# Altium schematic sheet USB_Host.SchDoc
size A4; DocumentNumber: 25; SheetNumber: 25; SheetTotal: 28
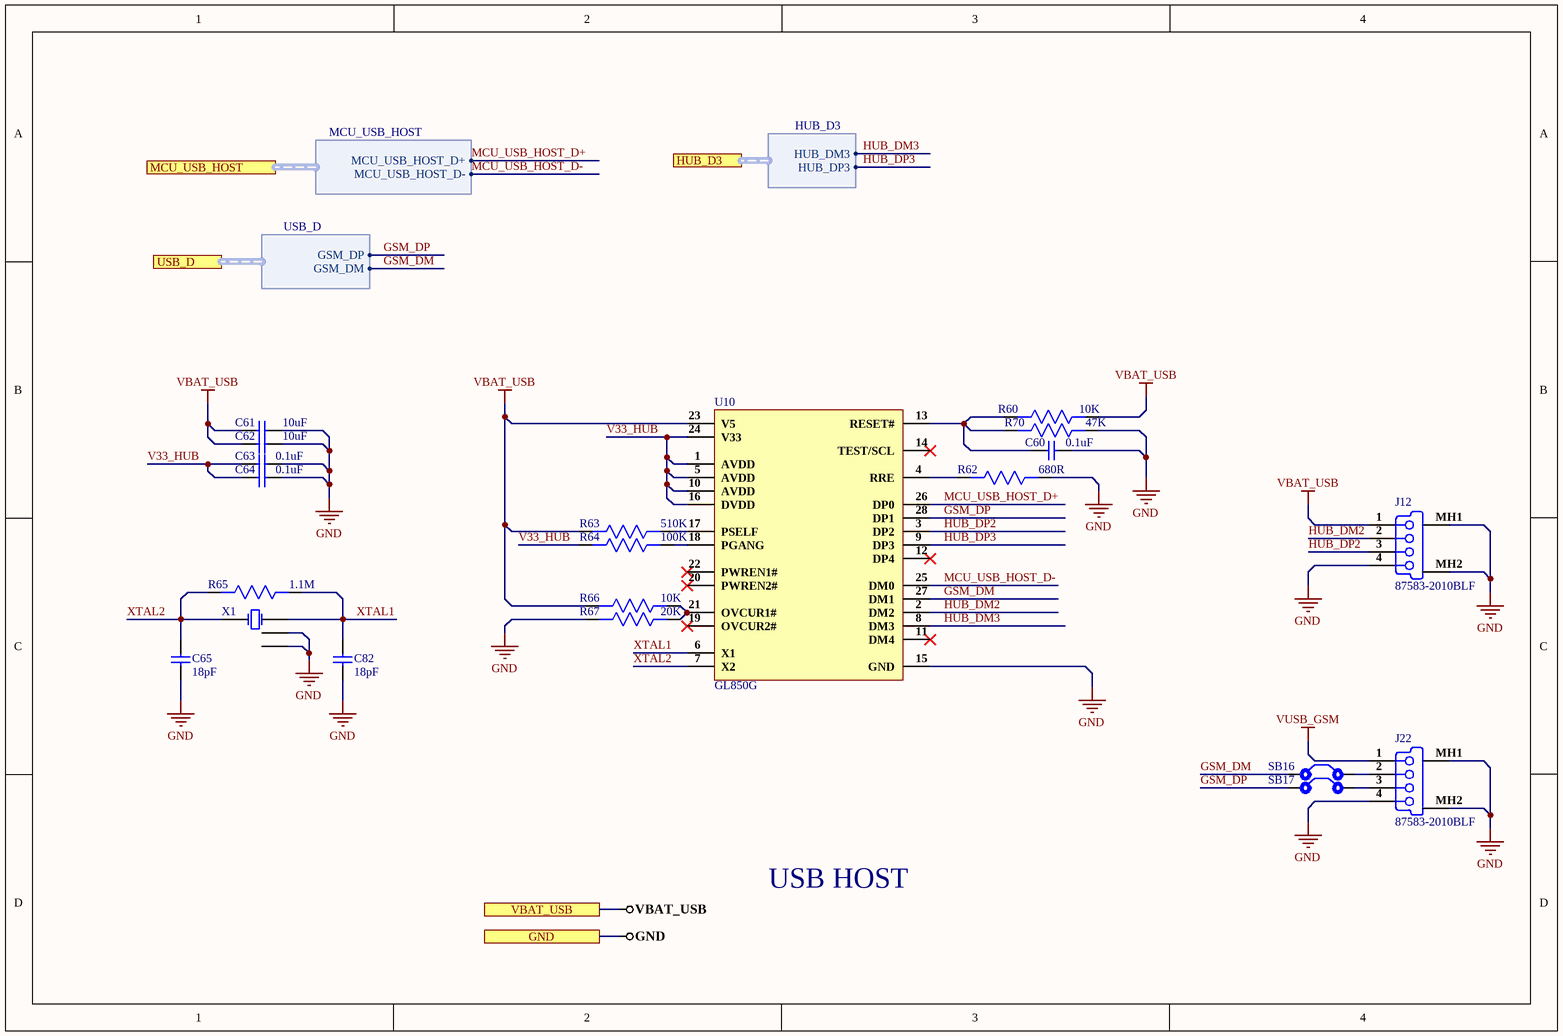
[diagram p0: USB_Host.SchDoc]

## Parts
C60  0.1uF  [Cap0603]
C61  10uF  [Cap0603]
C62  10uF  [Cap0603]
C63  0.1uF  [Cap0603]
C64  0.1uF  [Cap0603]
C65  18pF  [Cap0603]
C82  18pF  [Cap0603]
J12  87583-2010BLF  [87583-2010BLF]
J22  87583-2010BLF  [87583-2010BLF]
R60  10K  [Res0603]
R62  680R  [Res0603]
R63  510K  [Res0603]
R64  100K  [Res0603]
R65  1.1M  [Res0603]
R66  10K  [Res0603]
R67  20K  [Res0603]
R70  47K  [Res-0201]
SB16  Solder Bridge  [Solder Bridge]  (value not drawn)
SB17  Solder Bridge  [Solder Bridge]  (value not drawn)
U10  GL850G  [SSOP-28]
X1  8Z-12.000MAAJ-T  [8Z-12.000MAAJ-T]  (value not drawn)

## Ports
GND, HUB_D3 (harness HUB_D3), MCU_USB_HOST (harness MCU_USB_HOST), USB_D (harness USB_D), VBAT_USB

## Harnesses
MCU_USB_HOST: MCU_USB_HOST_D+, MCU_USB_HOST_D-
HUB_D3: HUB_DM3, HUB_DP3
USB_D: GSM_DP, GSM_DM

## Nets
GND: C60.2 C61.2 C62.2 C63.2 C64.2 C65.1 C82.1 J12.4(GND) J12.MH1(Tab) J12.MH2(Tab) J22.4(GND) J22.MH1(Tab) J22.MH2(Tab) R62.1 R67.2 R70.1 U10.15(GND) X1.2(GND) X1.4(GND) ; port GND
VBAT_USB: C61.1 C62.1 J12.1(V_BUS_(5V)) R60.1 R63.2 R66.2 U10.23(V5) ; port VBAT_USB
VUSB_GSM: J22.1(V_BUS_(5V))
GSM_DM: SB16.1 U10.27(DM1) ; port USB_D.GSM_DM
GSM_DP: SB17.1 U10.28(DP1) ; port USB_D.GSM_DP
HUB_DM2: J12.2(D-) U10.2(DM2)
HUB_DM3: U10.8(DM3) ; port HUB_D3.HUB_DM3
HUB_DP2: J12.3(D+) U10.3(DP2)
HUB_DP3: U10.9(DP3) ; port HUB_D3.HUB_DP3
MCU_USB_HOST_D+: U10.26(DP0) ; port MCU_USB_HOST.MCU_USB_HOST_D+
MCU_USB_HOST_D-: U10.25(DM0) ; port MCU_USB_HOST.MCU_USB_HOST_D-
V33_HUB: C63.1 C64.1 R64.2 U10.1(AVDD) U10.5(AVDD) U10.10(AVDD) U10.16(DVDD) U10.24(V33)
XTAL1: C82.2 R65.1 U10.6(X1) X1.1(OSC1)
XTAL2: C65.2 R65.2 U10.7(X2) X1.3(OSC2)
NetC60_1: C60.1 R60.2 R70.2 U10.13(RESET#)
NetJ22_2: J22.2(D-) SB16.2
NetJ22_3: J22.3(D+) SB17.2
NetR62_2: R62.2 U10.4(RRE)
NetR63_1: R63.1 U10.17(PSELF)
NetR64_1: R64.1 U10.18(PGANG)
NetR66_1: R66.1 R67.1 U10.21(OVCUR1#)

Not connected (* = marked no-connect by the designer): U10 11(DM4)* 12(DP4)* 14(TEST/SCL)* 19(OVCUR2#)* 20(PWREN2#)* 22(PWREN1#)*

## Notes on the sheet
- USB HOST

## Library data of the parts
C60 C63 C64 = CC0603ZRY5V9BB104: CAP CER 0.1UF 50V Y5V 0603; Manufacturer: Yageo; Capacitance: 100nF; Tolerance: 80%; Supplier 1: Digi-Key; Manufacturer Part Number: CC0603ZRY5V9BB104; Stock 1: 15000880; Pricing 1: 1=0.1, 10=0.075, 100=0.0334, 500=0.02386, 1000=0.01874 (USD); Mount: Surface Mount; Case/Package: 0603; Number of Pins: 2; Case Code (Metric): 1608; Case Code (Imperial): 0603; Min Operating Temperature: -30°C; Max Operating Temperature: 85°C; Dielectric: Y5V; Voltage Rating: 50V; Package Quantity: 1; Packaging: Tape and Reel; Voltage Rating (DC): 50V; Termination: SMD/SMT; Composition: Ceramic; Voltage: 50V; Length: 1.6mm; Height: 0.8mm; Width: 0.031inch; Thickness: 0.035inch; Depth: 0.8mm; Radiation Hardening: No; REACH SVHC: No SVHC; Lead Free: Lead Free; Halogen Free: Halogen Free; ComponentLink1URL: http://www.yageo.com/documents/recent/UPY-GPHC_Y5V_6.3V-to-50V_8.pdf?src-supplier=Digi-Key; ComponentLink1Description: http://www.yageo.com/documents/recent/UPY-GPHC_Y5V_6.3V-to-50V_8.pdf?src-supplier=Digi-Key; ComponentLink2URL: http://www.yageo.com/documents/recent/UPY-GPHC_Y5V_6.3V-to-50V_5.pdf?src-supplier=Avnet+Europe; ComponentLink2Description: http://www.yageo.com/documents/recent/UPY-GPHC_Y5V_6.3V-to-50V_5.pdf?src-supplier=Avnet+Europe; ComponentLink3URL: https://www.verical.com/server-webapp/html/getDatasheet?partID=403611&src-supplier=Verical; ComponentLink3Description: https://www.verical.com/server-webapp/html/getDatasheet?partID=403611&src-supplier=Verical; ComponentLink4URL: http://www.mouser.com/ds/2/447/Yageo_UPY-GP_NP0_16V-to-50V_9-358835.pdf?src-supplier=Mouser; ComponentLink4Description: http://www.mouser.com/ds/2/447/Yageo_UPY-GP_NP0_16V-to-50V_9-358835.pdf?src-supplier=Mouser; ComponentLink5URL: http://www.farnell.com/datasheets/1132289.pdf?src-supplier=Element14; ComponentLink5Description: http://www.farnell.com/datasheets/1132289.pdf?src-supplier=Element14; Supplier Part Number 1: 311-1343-1-ND
C61 C62 = GRM188R6YA106MA73D: CAP CER 10UF 35V X5R 0603; Manufacturer: Murata; Tolerance: 20%; Supplier 1: Digi-Key; Manufacturer Part Number: GRM188R6YA106MA73D; Stock 1: 11640; Pricing 1: 1=0.5, 10=0.346, 100=0.2076, 500=0.1557, 1000=0.13148 (USD); Mount: Surface Mount; Case/Package: 0603; Case Code (Metric): 1608; Case Code (Imperial): 0603; Min Operating Temperature: -55°C; Max Operating Temperature: 85°C; Packaging: Tape and Reel; Capacitance: 10uF; Voltage Rating: 35V; Voltage Rating (DC): 35V; Dielectric: X5R; Length: 0.063inch; Width: 0.031inch; Thickness: 0.039inch; ComponentLink1URL: http://search.murata.co.jp/Ceramy/image/img/A01X/G101/ENG/GRM188R6YA106MA73-01.pdf?src-supplier=Digi-Key; ComponentLink1Description: http://search.murata.co.jp/Ceramy/image/img/A01X/G101/ENG/GRM188R6YA106MA73-01.pdf?src-supplier=Digi-Key; ComponentLink2URL: http://search.murata.co.jp/Ceramy/image/img/A01X/G101/ENG/GRM188R6YA106MA73-01.pdf?src-supplier=Mouser; ComponentLink2Description: http://search.murata.co.jp/Ceramy/image/img/A01X/G101/ENG/GRM188R6YA106MA73-01.pdf?src-supplier=Mouser; ComponentLink3URL: https://www.murata.com/~/media/webrenewal/support/library/catalog/products/capacitor/mlcc/c02e.ashx?la=en-us&src-supplier=Digi-Key; ComponentLink3Description: https://www.murata.com/~/media/webrenewal/support/library/catalog/products/capacitor/mlcc/c02e.ashx?la=en-us&src-supplier=Digi-Key; ComponentLink4URL: http://search.murata.co.jp/Ceramy/image/img/A01X/G101/ENG/GRM188R6YA106MA73-01.pdf?src-supplier=Future+Electronics; ComponentLink4Description: http://search.murata.co.jp/Ceramy/image/img/A01X/G101/ENG/GRM188R6YA106MA73-01.pdf?src-supplier=Future+Electronics; ComponentLink5URL: http://search.murata.co.jp/Ceramy/image/img/A01X/G101/ENG/GRM188R6YA106MA73-01.pdf?src-supplier=TTI; ComponentLink5Description: http://search.murata.co.jp/Ceramy/image/img/A01X/G101/ENG/GRM188R6YA106MA73-01.pdf?src-supplier=TTI; Supplier Part Number 1: 490-13248-6-ND
C65 C82 = C0603C180J5GACTU: CAP CER 18PF 50V C0G/NP0 0603; Manufacturer: KEMET; Dielectric Material: Ceramic; Tolerance: 5%; Dielectric: C0G; Dissipation Factor: 0.1%; Temperature Coefficient: 30ppm/°C; Supplier 1: Digi-Key; Manufacturer Part Number: C0603C180J5GACTU; Stock 1: 196781; Pricing 1: 1=0.1, 10=0.049, 100=0.0217, 500=0.01552, 1000=0.01219 (USD); Mount: Surface Mount; Case/Package: 0603; Case Code (Imperial): 0603; Case Code (Metric): 1608; Min Operating Temperature: -55°C; Max Operating Temperature: 125°C; Packaging: Tape and Reel; Capacitance: 18pF; Package Quantity: 4000; Voltage Rating: 50V; Voltage Rating (DC): 50V; Termination: SMD/SMT; Voltage: 50V; Length: 1.6mm; Height: 0.8mm; Width: 0.8mm; Depth: 0.8mm; Radiation Hardening: No; Lead Free: Lead Free; ComponentLink1URL: http://www.kemet.com/kemet/web/homepage/kechome.nsf/file/F9080B_0402_Series_C0G/$file/F9080B_0402_Series_C0G.pdf?src-supplier=Element14; ComponentLink1Description: http://www.kemet.com/kemet/web/homepage/kechome.nsf/file/F9080B_0402_Series_C0G/$file/F9080B_0402_Series_C0G.pdf?src-supplier=Element14; ComponentLink2URL: http://www.farnell.com/datasheets/1372242.pdf?src-supplier=Element14; ComponentLink2Description: http://www.farnell.com/datasheets/1372242.pdf?src-supplier=Element14; Supplier Part Number 1: 399-1052-1-ND
J12 J22 = 87583-2010BLF: USB Connectors 4P RECEPTACLE TYPE A; Manufacturer: Amphenol FCI; Plating: Nickel; Number of Terminals/Pins: 4; Current Rating: 1A; Mating Cycles: 1500; Connector Type: USB,Receptacle; Number of Ports: 1; Contact Resistance: 30mR; Insulation Resistance: 1GR; USB Standard: USB 2.0; Supplier 1: Allied Electronics; Manufacturer Part Number: 87583-2010BLF; RoHS: Yes; Category: Connectors; Mount: Surface Mount,Horizontal; Contact Plating: GXT,Gold; Color: White; Contact Material: Copper Alloy; Body Plating: Nickel; Material: Tin; Housing Material: Thermoplastic; Min Operating Temperature: 0°C; Max Operating Temperature: 40°C; Termination: Solder; Gender: Receptacle; Packaging: Rail/Tube; Number of Contacts: 4; Orientation: Right Angle; Package Quantity: 42; Interface: USB; Number of Positions: 4; Series: 87583; Length: 14.5mm; Depth: 14mm; Radiation Hardening: No; Flammability Rating: UL94 V-0; REACH SVHC: No SVHC; RoHS Compliant: Yes; ComponentLink1URL: https://datasheet.ciiva.com/851/87583-851211.pdf?src-supplier=Digi-Key; ComponentLink1Description: https://datasheet.ciiva.com/851/87583-851211.pdf?src-supplier=Digi-Key; ComponentLink2URL: https://datasheet.ciiva.com/1100/57319-1100818.pdf?src-supplier=Newark; ComponentLink2Description: https://datasheet.ciiva.com/1100/57319-1100818.pdf?src-supplier=Newark; ComponentLink3URL: https://datasheet.ciiva.com/25614/0900766b8118e6e2-25614557.pdf?src-supplier=RSComponents; ComponentLink3Description: https://datasheet.ciiva.com/25614/0900766b8118e6e2-25614557.pdf?src-supplier=RSComponents; ComponentLink4URL: https://datasheet.ciiva.com/4599/gs-12-095-532824-4599287.pdf?src-supplier=Mouser; ComponentLink4Description: https://datasheet.ciiva.com/4599/gs-12-095-532824-4599287.pdf?src-supplier=Mouser; ComponentLink5URL: https://datasheet.ciiva.com/15181/getdatasheetpartid-106468-15181159.pdf?src-supplier=Verical; ComponentLink5Description: https://datasheet.ciiva.com/15181/getdatasheetpartid-106468-15181159.pdf?src-supplier=Verical; ComponentLink6URL: https://datasheet.ciiva.com/3094/87583-3094440.pdf?src-supplier=Avnet; ComponentLink6Description: https://datasheet.ciiva.com/3094/87583-3094440.pdf?src-supplier=Avnet; ComponentLink7URL: https://datasheet.ciiva.com/14619/70236897-14619037.pdf?src-supplier=Allied+Electronics; ComponentLink7Description: https://datasheet.ciiva.com/14619/70236897-14619037.pdf?src-supplier=Allied+Electronics; Supplier Part Number 1: 70236897
R60 R66 = AC0603JR-0710KL: RES SMD 10K OHM 5% 1/10W 0603; Manufacturer: Yageo; Voltage Rating: 50V; Resistance: 10kR; Power Rating: 100mW; Temperature Coefficient: 100ppm/°C; Supplier 1: Future Electronics; Manufacturer Part Number: AC0603JR-0710KL; RoHS: Yes; Category: Chip SMD Resistors; Stock 1: 1533000; Pricing 1: 5000=0.00540 (USD); Case/Package: 0603; Case Code (Imperial): 0603; Case Code (Metric): 1608; Size Code: 0603; Min Operating Temperature: -55°C; Max Operating Temperature: 155°C; Packaging: Tape and Reel; Tolerance: 5%; Package Quantity: 1; Resistor Type: Thick Film; Termination: SMD/SMT; Number of Terminations: 2; Max Power Dissipation: 100mW; Features: Moisture Resistant,Automotive AEC-Q200,Anti-Sulfur; Series: AC; Construction: Rectangular; Length: 0.063inch; Width: 0.031inch; Height: 0.022inch; Depth: 0.8mm; Military Standard: Not; Lead Free: Lead Free; RoHS Compliant: Yes; ComponentLink1URL: https://datasheet.ciiva.com/5562/pyu-ac-51-rohs-l-2-5562553.pdf?src-supplier=Mouser; ComponentLink1Description: https://datasheet.ciiva.com/5562/pyu-ac-51-rohs-l-2-5562553.pdf?src-supplier=Mouser; Supplier Part Number 1: 1029044
R62 = RC0603FR-07680RL: RES SMD 680 OHM 1% 1/10W 0603; Manufacturer: Yageo; Temperature Coefficient: 100ppm/°C; Voltage Rating (DC): 50V; Power Rating: 100mW; Supplier 1: Digi-Key; Manufacturer Part Number: RC0603FR-07680RL; Stock 1: 4278227; Pricing 1: 1=0.1, 10=0.024, 100=0.0097, 1000=0.00437, 2500=0.00379 (USD); Case/Package: 0603; Number of Pins: 2; Case Code (Imperial): 0603; Case Code (Metric): 1608; Min Operating Temperature: -55°C; Max Operating Temperature: 155°C; Resistance: 680R; Tolerance: 1%; Composition: Thick Film; Packaging: Tape and Reel; Number of Terminations: 2; Military Standard: Not; Voltage Rating: 50V; Package Quantity: 1; Termination: SMD/SMT; Max Power Dissipation: 100mW; Features: Moisture Resistant; Length: 1.6mm; Height: 0.022inch; Width: 0.031inch; Depth: 0.8mm; REACH SVHC: No SVHC; Lead Free: Lead Free; ComponentLink1URL: http://www.farnell.com/datasheets/1868787.pdf?src-supplier=Element14; ComponentLink1Description: http://www.farnell.com/datasheets/1868787.pdf?src-supplier=Element14; ComponentLink2URL: http://documents.rs-components.com/techlib://itc_doclist_GB.htm?stockno=5048221&src-supplier=RSComponents; ComponentLink2Description: http://documents.rs-components.com/techlib://itc_doclist_GB.htm?stockno=5048221&src-supplier=RSComponents; ComponentLink3URL: http://www.farnell.com/datasheets/443971.pdf?src-supplier=Element14; ComponentLink3Description: http://www.farnell.com/datasheets/443971.pdf?src-supplier=Element14; ComponentLink4URL: http://www.yageo.com/documents/recent/PYu-RC_Group_51_RoHS_L_10.pdf?src-supplier=Digi-Key; ComponentLink4Description: http://www.yageo.com/documents/recent/PYu-RC_Group_51_RoHS_L_10.pdf?src-supplier=Digi-Key; Supplier Part Number 1: 311-680HRCT-ND
R63 = RK73B1JTTD514J: RES 510K OHM 5% 1/10W 0603; Manufacturer: KOA Speer; Resistance: 510kR; Power Rating: 100mW; Voltage Rating: 50V; Temperature Coefficient: 200ppm/°C; Supplier 1: Digi-Key; Manufacturer Part Number: RK73B1JTTD514J; RoHS: Yes; Category: Chip SMD Resistors; Stock 1: 50000; Pricing 1: 1=0.10000, 10=0.01400, 100=0.00580, 1000=0.00262, 2500=0.00228 (USD); Case/Package: 0603; Case Code (Imperial): 0603; Case Code (Metric): 1608; Min Operating Temperature: -55°C; Max Operating Temperature: 155°C; Packaging: Tape and Reel; Tolerance: 5%; Package Quantity: 5000; Resistor Type: Thick Film; Termination: SMD/SMT; Voltage Rating (DC): 50V; Series: RK73B; Technology: THICK FILM; Resistance Tolerance: 5%; Construction: Rectangular; Length: 1.6mm; Width: 0.8mm; Height: 0.45mm; Depth: 0.8mm; REACH SVHC: Unknown; Military Standard: Not; Lead Free: Lead Free; RoHS Compliant: Yes; ComponentLink1URL: https://datasheet.ciiva.com/5555/rk73b-5555496.pdf?src-supplier=Mouser; ComponentLink1Description: https://datasheet.ciiva.com/5555/rk73b-5555496.pdf?src-supplier=Mouser; ComponentLink2URL: https://datasheet.ciiva.com/7763/548635-7763065.pdf?src-supplier=Element14; ComponentLink2Description: https://datasheet.ciiva.com/7763/548635-7763065.pdf?src-supplier=Element14; ComponentLink3URL: https://datasheet.ciiva.com/15202/getdatasheetpartid-423620-15202714.pdf?src-supplier=Verical; ComponentLink3Description: https://datasheet.ciiva.com/15202/getdatasheetpartid-423620-15202714.pdf?src-supplier=Verical; Supplier Part Number 1: 2019-RK73B1JTTD514JCT-ND
R64 = CRGH0603J100K: RES SMD 100K OHM 5% 1/5W 0603; Manufacturer: TE Connectivity; Resistance: 100kR; Temperature Coefficient: 100ppm/°C; Power Rating: 200mW; Voltage Rating: 50V; Number of Resistors: 1; Supplier 1: Digi-Key; Manufacturer Part Number: CRGH0603J100K; Stock 1: 23277; Pricing 1: 1=0.1, 10=0.049, 100=0.02, 1000=0.00899, 2500=0.0078 (USD); Mount: Surface Mount; Case/Package: 0603; Case Code (Imperial): 0603; Case Code (Metric): 1608; Min Operating Temperature: -55°C; Max Operating Temperature: 125°C; Tolerance: 5%; Packaging: Tape and Reel; Resistor Type: Thick Film,Power resistor; Number of Terminations: 2; Series: CRGH; Termination: Solder; Voltage Rating (DC): 50V; Resistance Tolerance: 5%; Technology: THICK FILM; Length: 1.6mm; Width: 0.8mm; Height: 0.45mm; Depth: 0.8mm; RoHS Compliant: Yes; REACH SVHC: No SVHC; ELV: Compliant; ComponentLink1URL: http://www.farnell.com/datasheets/2007183.pdf?src-supplier=Element14; ComponentLink1Description: http://www.farnell.com/datasheets/2007183.pdf?src-supplier=Element14; Supplier Part Number 1: A126393DKR-ND
R65 = RC0603FR-071M1L: RES SMD 1.1M OHM 1% 1/10W 0603; Manufacturer: Yageo; Resistance: 1.1MR; Temperature Coefficient: 100ppm/°C; Power Rating: 100mW; Voltage Rating: 50V; Supplier 1: Digi-Key; Manufacturer Part Number: RC0603FR-071M1L; RoHS: Yes; Category: Chip SMD Resistors; Stock 1: 137699; Pricing 1: 1=0.10000, 10=0.02400, 100=0.00970, 1000=0.00436, 2500=0.00378 (USD); Mount: Surface Mount; Case/Package: 0603; Contact Plating: Tin,Matte; Case Code (Imperial): 0603; Case Code (Metric): 1608; Size Code: 0603; Min Operating Temperature: -55°C; Max Operating Temperature: 155°C; Tolerance: 1%; Resistor Type: Thick Film; Packaging: Tape and Reel; Number of Terminations: 2; Termination: SMD/SMT; Max Power Dissipation: 100mW; Features: Moisture Resistant; Series: RC; Technology: THICK FILM; Construction: Rectangular; Length: 1.6mm; Width: 0.031inch; Height: 0.45mm; Depth: 0.8mm; Military Standard: Not; Lead Free: Lead Free; RoHS Compliant: Yes; ComponentLink1URL: https://datasheet.ciiva.com/11808/0900766b80c66297-11808821.pdf?src-supplier=RSComponents; ComponentLink1Description: https://datasheet.ciiva.com/11808/0900766b80c66297-11808821.pdf?src-supplier=RSComponents; ComponentLink2URL: https://datasheet.ciiva.com/28419/pyu-rc0603-51-rohs-l-4-28419097.pdf?src-supplier=Avnet+Europe; ComponentLink2Description: https://datasheet.ciiva.com/28419/pyu-rc0603-51-rohs-l-4-28419097.pdf?src-supplier=Avnet+Europe; ComponentLink3URL: https://datasheet.ciiva.com/12560/rc0603-272842-12560493.pdf?src-supplier=Mouser; ComponentLink3Description: https://datasheet.ciiva.com/12560/rc0603-272842-12560493.pdf?src-supplier=Mouser; Supplier Part Number 1: YAG3324CT-ND
R67 = ESR03EZPF2002: RES SMD 20K OHM 1% 1/4W 0603; Manufacturer: Rohm; Resistance: 20kR; Max Power Dissipation: 250mW; Temperature Coefficient: 100ppm/°C; Supplier 1: Digi-Key; Manufacturer Part Number: ESR03EZPF2002; Stock 1: 4737; Pricing 1: 1=0.13, 10=0.12, 100=0.046, 1000=0.02024, 2500=0.01748 (USD); Case/Package: 0603; Case Code (Metric): 1608; Case Code (Imperial): 0603; Min Operating Temperature: -55°C; Max Operating Temperature: 155°C; Package Quantity: 1; Tolerance: 1%; Packaging: Tape and Reel; Resistor Type: Thick Film; Number of Terminations: 2; Features: Automotive AEC-Q200; Series: ESR; Length: 0.063inch; Width: 0.031inch; Height: 0.022inch; RoHS Compliant: Yes; ComponentLink1URL: https://www.rohm.com/datasheet/ESR01MZPF/esr-e?src-supplier=Digi-Key; ComponentLink1Description: https://www.rohm.com/datasheet/ESR01MZPF/esr-e?src-supplier=Digi-Key; Supplier Part Number 1: RHM20.0KADCT-ND
R70 = RC0201JR-0747KL: RES SMD 47K OHM 5% 1/20W 0201; Manufacturer: Yageo; Resistance: 47kR; Temperature Coefficient: 200ppm/°C; Voltage Rating: 25V; Power Rating: 50mW; Supplier 1: Digi-Key; Manufacturer Part Number: RC0201JR-0747KL; RoHS: Yes; Category: Chip SMD Resistors; Stock 1: 472205; Pricing 1: 1=0.10000, 10=0.02800, 100=0.01140, 1000=0.00513, 2500=0.00445, 5000=0.00368 (USD); Case/Package: 0201; Number of Pins: 2; Contact Plating: Tin,Matte; Case Code (Metric): 0603; Case Code (Imperial): 0201; Min Operating Temperature: -55°C; Max Operating Temperature: 125°C; Tolerance: 5%; Resistor Type: Thick Film; Package Quantity: 10000; Packaging: Tape and Reel; Number of Terminations: 2; Termination: SMD/SMT; Max Power Dissipation: 50mW; Voltage Rating (DC): 25V; Working Voltage: 25V; Features: Moisture Resistant; Series: RC; Resistance Tolerance: 5%; Construction: Rectangular; Technology: THICK FILM; Length: 0.6mm; Width: 0.3mm; Height: 0.01inch; Depth: 0.3mm; Radiation Hardening: No; REACH SVHC: No SVHC; Military Standard: Not; Lead Free: Lead Free; RoHS Compliant: Yes; ComponentLink1URL: https://datasheet.ciiva.com/2492/pyu-r-int-thick-7-2492966.pdf?src-supplier=Digi-Key; ComponentLink1Description: https://datasheet.ciiva.com/2492/pyu-r-int-thick-7-2492966.pdf?src-supplier=Digi-Key; ComponentLink2URL: https://datasheet.ciiva.com/5989/1563626-5989624.pdf?src-supplier=Farnell; ComponentLink2Description: https://datasheet.ciiva.com/5989/1563626-5989624.pdf?src-supplier=Farnell; ComponentLink3URL: https://datasheet.ciiva.com/28399/pyu-rc0201-51-rohs-l-8-28399338.pdf?src-supplier=Avnet+Europe; ComponentLink3Description: https://datasheet.ciiva.com/28399/pyu-rc0201-51-rohs-l-8-28399338.pdf?src-supplier=Avnet+Europe; ComponentLink4URL: https://datasheet.ciiva.com/8889/pyu-rc0201-51-rohs-l-8-8889071.pdf?src-supplier=Avnet; ComponentLink4Description: https://datasheet.ciiva.com/8889/pyu-rc0201-51-rohs-l-8-8889071.pdf?src-supplier=Avnet; ComponentLink5URL: https://datasheet.ciiva.com/2492/pyu-r-int-thick-7-2492965.pdf?src-supplier=Digi-Key; ComponentLink5Description: https://datasheet.ciiva.com/2492/pyu-r-int-thick-7-2492965.pdf?src-supplier=Digi-Key; ComponentLink6URL: https://datasheet.ciiva.com/2492/pyu-r-int-thick-7-2492967.pdf?src-supplier=Digi-Key; ComponentLink6Description: https://datasheet.ciiva.com/2492/pyu-r-int-thick-7-2492967.pdf?src-supplier=Digi-Key; ComponentLink7URL: https://datasheet.ciiva.com/16855/pyu-rc0201-51-rohs-l-8-16855517.pdf?src-supplier=Avnet+Europe; ComponentLink7Description: https://datasheet.ciiva.com/16855/pyu-rc0201-51-rohs-l-8-16855517.pdf?src-supplier=Avnet+Europe; Supplier Part Number 1: 311-47KNCT-ND
SB16 SB17 = Solder Bridge: Solder Bridge ON
U10 = GL850G: USB 2.0 Hub Controller
X1 = 8Z-12.000MAAJ-T: CRYSTAL 12.0000MHZ 18PF SMD; Manufacturer: TXC; Frequency: 12MHz; Frequency Tolerance: 30ppm; ESR (Equivalent Series Resistance): 150R; Supplier 1: Mouser; Manufacturer Part Number: 8Z-12.000MAAJ-T; RoHS: Yes; Category: Crystals; Stock 1: 33; Pricing 1: 1=1.41000, 10=1.36000, 50=1.33000, 100=1.13000, 1000=0.93000, 10000=0.78000 (USD); Mount: Surface Mount; Case/Package: SMD/SMT; Number of Pins: 4; Min Operating Temperature: -20°C; Max Operating Temperature: 70°C; Package Quantity: 1; Load Capacitance: 18pF; Packaging: Tape and Reel; Tolerance: 30ppm; Frequency Stability: 30ppm; Termination: SMD/SMT; Series: 8Z; Length: 2.5mm; Width: 0.079inch; Height: 0.022inch; Depth: 2mm; REACH SVHC: No SVHC; RoHS Compliant: Yes; ComponentLink1URL: https://datasheet.ciiva.com/28498/1838674-28498900.pdf?src-supplier=Element14; ComponentLink1Description: https://datasheet.ciiva.com/28498/1838674-28498900.pdf?src-supplier=Element14; ComponentLink2URL: https://datasheet.ciiva.com/4950/8z-12784-4950167.pdf?src-supplier=Mouser; ComponentLink2Description: https://datasheet.ciiva.com/4950/8z-12784-4950167.pdf?src-supplier=Mouser; ComponentLink3URL: https://datasheet.ciiva.com/859/8z-859073.pdf?src-supplier=Digi-Key; ComponentLink3Description: https://datasheet.ciiva.com/859/8z-859073.pdf?src-supplier=Digi-Key; ComponentLink4URL: https://datasheet.ciiva.com/859/8z-859071.pdf?src-supplier=Digi-Key; ComponentLink4Description: https://datasheet.ciiva.com/859/8z-859071.pdf?src-supplier=Digi-Key; ComponentLink5URL: https://datasheet.ciiva.com/859/8z-859072.pdf?src-supplier=Digi-Key; ComponentLink5Description: https://datasheet.ciiva.com/859/8z-859072.pdf?src-supplier=Digi-Key; ComponentLink6URL: https://datasheet.ciiva.com/8047/1041872-8047871.pdf?src-supplier=Element14; ComponentLink6Description: https://datasheet.ciiva.com/8047/1041872-8047871.pdf?src-supplier=Element14; Supplier Part Number 1: 717-8Z-12.000MAAJ-T